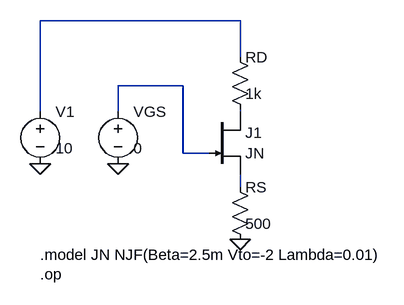
[diagram p0: schematic lab5_guide01.asc]
lab5_guide01.asc, the LTspice schematic file:
Version 4
SHEET 1 880 680
WIRE 60 200 60 60
WIRE 60 60 368 60
WIRE 368 60 368 116
WIRE 368 196 368 200
WIRE 368 296 368 316
WIRE 180 200 180 160
WIRE 180 160 280 160
WIRE 280 160 280 264
WIRE 280 264 320 264
FLAG 60 280 0
FLAG 180 280 0
FLAG 368 396 0
SYMBOL voltage 60 184 R0
WINDOW 0 24 16 Left 2
WINDOW 3 24 72 Left 2
SYMATTR InstName V1
SYMATTR Value 10
SYMBOL res 352 100 R0
WINDOW 0 24 16 Left 2
WINDOW 3 24 72 Left 2
SYMATTR InstName RD
SYMATTR Value 1k
SYMBOL njf 320 200 R0
WINDOW 0 56 32 Left 2
WINDOW 3 56 64 Left 2
SYMATTR InstName J1
SYMATTR Value JN
SYMBOL res 352 300 R0
WINDOW 0 24 16 Left 2
WINDOW 3 24 72 Left 2
SYMATTR InstName RS
SYMATTR Value 500
SYMBOL voltage 180 184 R0
WINDOW 0 24 16 Left 2
WINDOW 3 24 72 Left 2
SYMATTR InstName VGS
SYMATTR Value 0
TEXT 60 420 Left 2 !.model JN NJF(Beta=2.5m Vto=-2 Lambda=0.01)
TEXT 60 450 Left 2 !.op

The netlist it stands for:
* lab5_guide01.asc
V1 N001 0 10
RD N001 N002 1k
J1 N002 N004 N003 JN
RS N003 0 500
VGS N004 0 0
.model NJF NJF
.model PJF PJF
.lib standard.jft
.model JN NJF(Beta=2.5m Vto=-2 Lambda=0.01)
.op
.backanno
.end